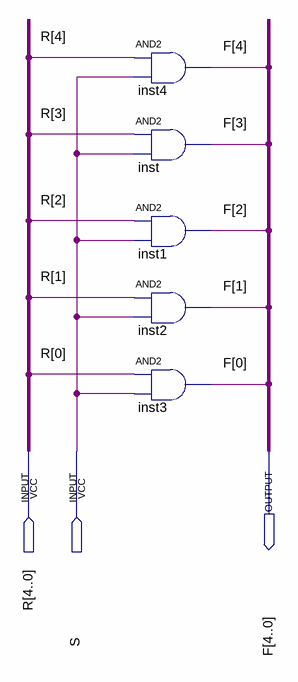
[diagram p0: schematic sheet]
// Quartus schematic and_seletor_5bits.bdf as structural Verilog: 5 symbols, 3 pins
module and_seletor_5bits (
  input  [4:0] R,
  input  S,
  output [4:0] F
);

  and inst4 (F[4], R[4], S);
  and inst (F[3], R[3], S);
  and inst1 (F[2], R[2], S);
  and inst2 (F[1], R[1], S);
  and inst3 (F[0], R[0], S);
endmodule
